# Altium schematic sheet HeartRate_SpO2_Monitor.SchDoc
size A4; SheetNumber: 1; SheetTotal: 2
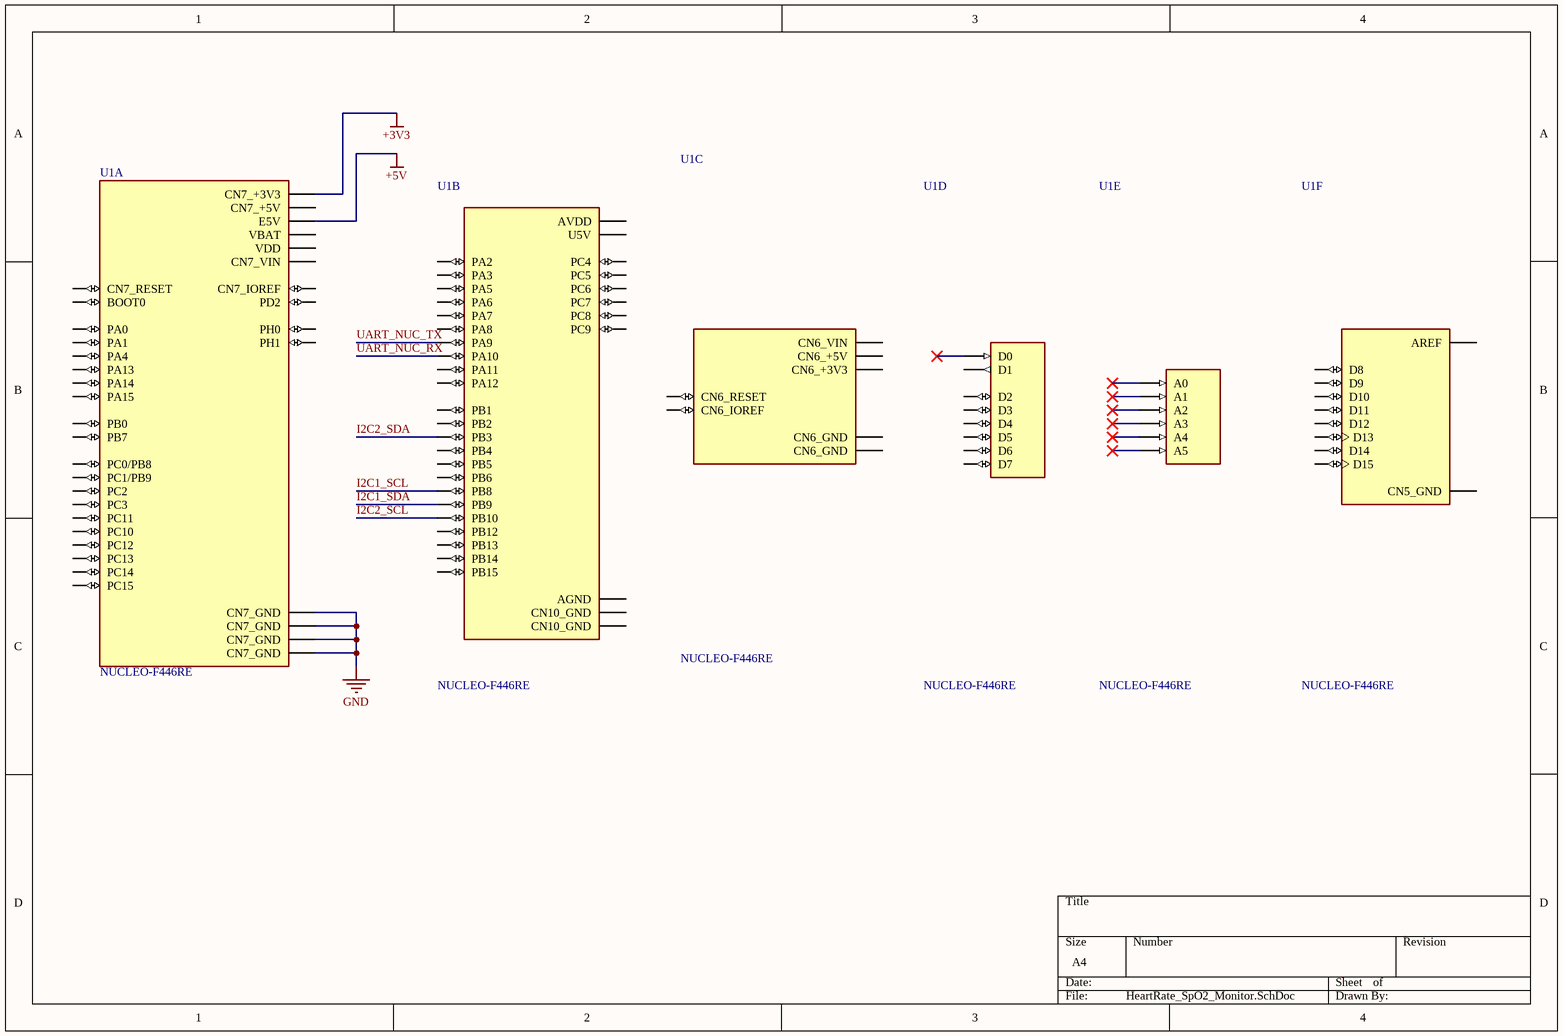
[diagram p0: HeartRate_SpO2_Monitor.SchDoc]

## Parts
U1  NUCLEO-F446RE  [MODULE_NUCLEO-F446RE]  (parts A,B,C,D,E,F of 6)

## Nets
+3V3: U1.CN7_16(CN7_+3V3)
+5V: U1.CN7_6(E5V)
GND: U1.CN7_8(CN7_GND) U1.CN7_19(CN7_GND) U1.CN7_20(CN7_GND) U1.CN7_22(CN7_GND)
I2C1_SCL: U1.CN10_3(PB8)
I2C1_SDA: U1.CN10_5(PB9)
I2C2_SCL: U1.CN10_25(PB10)
I2C2_SDA: U1.CN10_31(PB3)
UART_NUC_RX: U1.CN10_33(PA10)
UART_NUC_TX: U1.CN10_21(PA9)

Not connected (* = marked no-connect by the designer): U1 CN5_1(D8) CN5_2(D9) CN5_3(D10) CN5_4(D11) CN5_5(D12) CN5_6(D13) CN5_7(CN5_GND) CN5_8(AREF) CN5_9(D14) CN5_10(D15) CN6_2(CN6_IOREF) CN6_3(CN6_RESET) CN6_4(CN6_+3V3) CN6_5(CN6_+5V) CN6_6(CN6_GND) CN6_7(CN6_GND) CN6_8(CN6_VIN) CN7_1(PC10) CN7_2(PC11) CN7_3(PC12) CN7_4(PD2) CN7_5(VDD) CN7_7(BOOT0) CN7_12(CN7_IOREF) CN7_13(PA13) CN7_14(CN7_RESET) CN7_15(PA14) CN7_17(PA15) CN7_18(CN7_+5V) CN7_21(PB7) CN7_23(PC13) CN7_24(CN7_VIN) CN7_25(PC14) CN7_27(PC15) CN7_28(PA0) CN7_29(PH0) CN7_30(PA1) CN7_31(PH1) CN7_32(PA4) CN7_33(VBAT) CN7_34(PB0) CN7_35(PC2) CN7_36(PC1/PB9) CN7_37(PC3) CN7_38(PC0/PB8) CN8_1(A0)* CN8_2(A1)* CN8_3(A2)* CN8_4(A3)* CN8_5(A4)* CN8_6(A5)* CN9_1(D0)* CN9_2(D1) CN9_3(D2) CN9_4(D3) CN9_5(D4) CN9_6(D5) CN9_7(D6) CN9_8(D7) CN10_1(PC9) CN10_2(PC8) CN10_4(PC6) CN10_6(PC5) CN10_7(AVDD) CN10_8(U5V) CN10_9(CN10_GND) CN10_11(PA5) CN10_12(PA12) CN10_13(PA6) CN10_14(PA11) CN10_15(PA7) CN10_16(PB12) CN10_17(PB6) CN10_19(PC7) CN10_20(CN10_GND) CN10_22(PB2) CN10_23(PA8) CN10_24(PB1) CN10_26(PB15) CN10_27(PB4) CN10_28(PB14) CN10_29(PB5) CN10_30(PB13) CN10_32(AGND) CN10_34(PC4) CN10_35(PA2) CN10_37(PA3)

## Library data of the parts
U1 = NUCLEO-F446RE: STM32F446RE, mbed-Enabled Development Nucleo-64 STM32F4 ARMÂ® CortexÂ®-M4 MCU 32-Bit Embedded Evaluation Board; MF: STMicroelectronics; SnapEDA_Link: https://www.snapeda.com/parts/NUCLEO-F446RE/STMicroelectronics/view-part/?ref=snap; Package: None; Value: *; MP: NUCLEO-F446RE; Check_prices: https://www.snapeda.com/parts/NUCLEO-F446RE/STMicroelectronics/view-part/?ref=eda